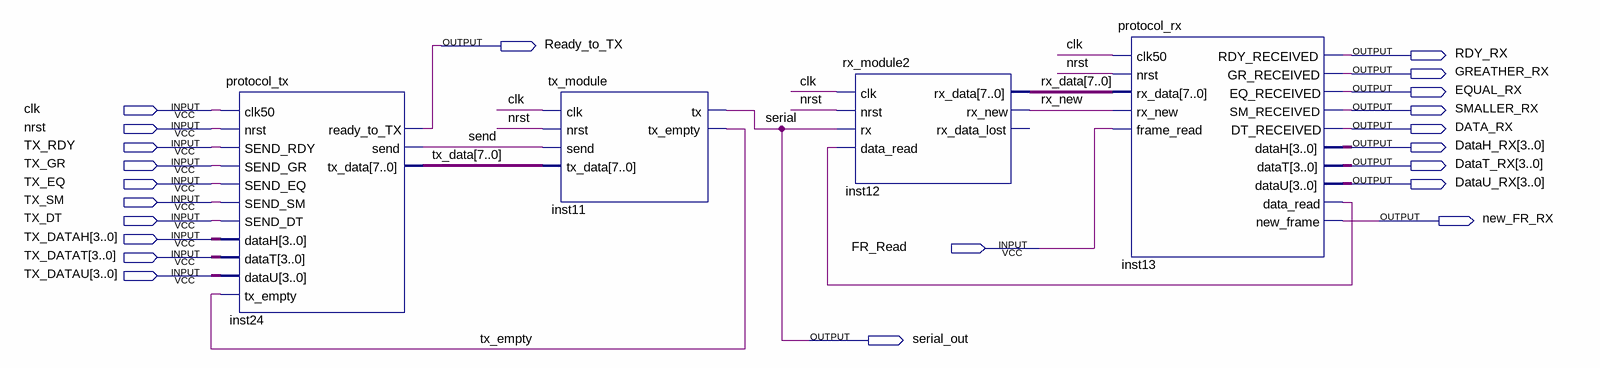
[diagram p0: schematic sheet]
// Quartus schematic TX_RX_BLOCK.bdf as structural Verilog: 4 symbols, 22 pins
module TX_RX_BLOCK (
  input  clk,
  input  nrst,
  input  TX_RDY,
  input  TX_GR,
  input  TX_EQ,
  input  TX_SM,
  input  TX_DT,
  input  [3:0] TX_DATAH,
  input  FR_Read,
  input  [3:0] TX_DATAT,
  input  [3:0] TX_DATAU,
  output Ready_to_TX,
  output RDY_RX,
  output GREATHER_RX,
  output EQUAL_RX,
  output SMALLER_RX,
  output DATA_RX,
  output [3:0] DataH_RX,
  output [3:0] DataT_RX,
  output [3:0] DataU_RX,
  output new_FR_RX,
  output serial_out
);

  wire inst13_data_read, rx_new, send, tx_empty;
  wire [7:0] rx_data, tx_data;

  protocol_tx inst24 (
    .clk50(clk), .nrst(nrst), .SEND_RDY(TX_RDY), .SEND_GR(TX_GR), .SEND_EQ(TX_EQ), .SEND_SM(TX_SM),
    .SEND_DT(TX_DT), .dataH(TX_DATAH), .dataT(TX_DATAT), .dataU(TX_DATAU), .tx_empty(tx_empty),
    .tx_data(tx_data), .ready_to_TX(Ready_to_TX), .send(send));
  tx_module inst11 (.clk(clk), .nrst(nrst), .send(send), .tx_data(tx_data), .tx(serial_out), .tx_empty(tx_empty));
  rx_module2 inst12 (
    .clk(clk), .nrst(nrst), .rx(serial_out), .data_read(inst13_data_read), .rx_data(rx_data), .rx_new(rx_new));  // open: rx_data_lost
  protocol_rx inst13 (
    .clk50(clk), .nrst(nrst), .rx_data(rx_data), .rx_new(rx_new), .frame_read(FR_Read),
    .RDY_RECEIVED(RDY_RX), .GR_RECEIVED(GREATHER_RX), .EQ_RECEIVED(EQUAL_RX), .SM_RECEIVED(SMALLER_RX),
    .DT_RECEIVED(DATA_RX), .dataH(DataH_RX), .dataT(DataT_RX), .dataU(DataU_RX),
    .data_read(inst13_data_read), .new_frame(new_FR_RX));

  // Other names for the same wires on the sheet: serial = serial_out
endmodule
